# Altium schematic sheet PSU.SchDoc: PDM
size A3; Author: Gustavo Gago; CompanyName: eUSRacing; DrawnBy: Gustavo Gago; SheetNumber: 8; SheetTotal: 8
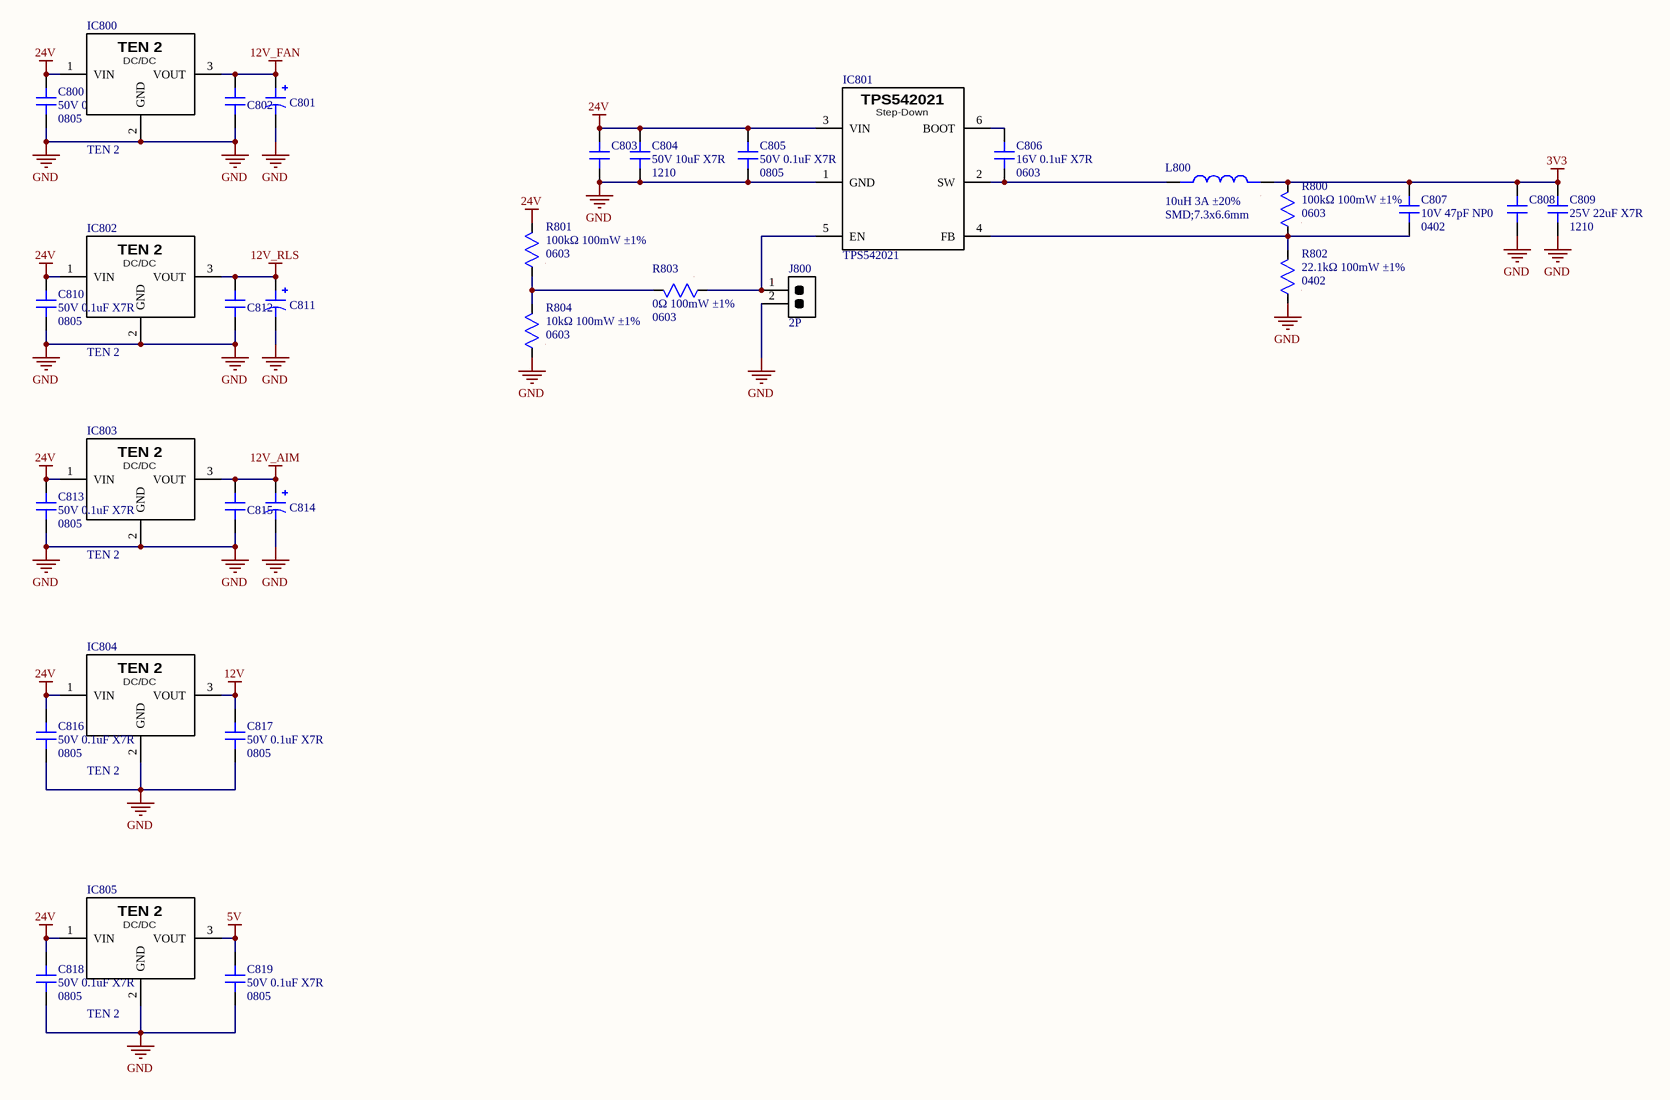
[diagram p0: PSU.SchDoc]

## Parts
C800  value 50V 0.1uF X7R  Package: 0805  [CAP SMD 0805]  (hidden comment: CAP non polarized)
C801  CAP polarized  [CAP_SMD_D6.3xL7.7mm]  (value not drawn)
C802  CAP non polarized  [CAP SMD 0805]  (value not drawn)
C803  CAP non polarized  [CAP SMD 1210]  (value not drawn)
C804  value 50V 10uF X7R  Package: 1210  [CAP SMD 1210]  (hidden comment: CAP non polarized)
C805  value 50V 0.1uF X7R  Package: 0805  [CAP SMD 0805]  (hidden comment: CAP non polarized)
C806  value 16V 0.1uF X7R  Package: 0603  [CAP SMD 0603]  (hidden comment: CAP non polarized)
C807  value 10V 47pF NP0  Package: 0402  [CAP SMD 0402]  (hidden comment: CAP non polarized)
C808  CAP non polarized  [CAP SMD 1210]  (value not drawn)
C809  value 25V 22uF X7R  Package: 1210  [CAP SMD 1210]  (hidden comment: CAP non polarized)
C810  value 50V 0.1uF X7R  Package: 0805  [CAP SMD 0805]  (hidden comment: CAP non polarized)
C811  CAP polarized  [CAP_SMD_D6.3xL7.7mm]  (value not drawn)
C812  CAP non polarized  [CAP SMD 0805]  (value not drawn)
C813  value 50V 0.1uF X7R  Package: 0805  [CAP SMD 0805]  (hidden comment: CAP non polarized)
C814  CAP polarized  [CAP_SMD_D6.3xL7.7mm]  (value not drawn)
C815  CAP non polarized  [CAP SMD 0805]  (value not drawn)
C816  value 50V 0.1uF X7R  Package: 0805  [CAP SMD 0805]  (hidden comment: CAP non polarized)
C817  value 50V 0.1uF X7R  Package: 0805  [CAP SMD 0805]  (hidden comment: CAP non polarized)
C818  value 50V 0.1uF X7R  Package: 0805  [CAP SMD 0805]  (hidden comment: CAP non polarized)
C819  value 50V 0.1uF X7R  Package: 0805  [CAP SMD 0805]  (hidden comment: CAP non polarized)
IC800  TEN 2  [TEN 2]
IC801  TPS542021  [TSOT-23-6]
IC802  TEN 2  [TEN 2]
IC803  TEN 2  [TEN 2]
IC804  TEN 2  [TEN 2]
IC805  TEN 2  [TEN 2]
J800  value 2P  [PIN_HEADER_THT_2P]  (hidden comment: CONN 2P)
L800  value 10uH 3A ±20%  Package: SMD;7.3x6.6mm  [IND SMD 7.3x6.6]  (hidden comment: IND)
R800  value 100kΩ 100mW ±1%  Package: 0603  [RES SMD 0603]  (hidden comment: RES)
R801  value 100kΩ 100mW ±1%  Package: 0603  [RES SMD 0603]  (hidden comment: RES)
R802  value 22.1kΩ 100mW ±1%  Package: 0402  [RES SMD 0402]  (hidden comment: RES)
R803  value 0Ω 100mW ±1%  Package: 0603  [RES SMD 0603]  (hidden comment: RES)
R804  value 10kΩ 100mW ±1%  Package: 0603  [RES SMD 0603]  (hidden comment: RES)

## Nets
3V3: C807.1 C808.1 C809.1 L800.2 R800.2
5V: C819.1 IC805.3(VOUT)
12V: C817.1 IC804.3(VOUT)
12V_AIM: C814.P C815.1 IC803.3(VOUT)
12V_FAN: C801.P C802.1 IC800.3(VOUT)
12V_RLS: C811.P C812.1 IC802.3(VOUT)
24V: C800.1 C803.1 C804.1 C805.1 C810.1 C813.1 C816.1 C818.1 IC800.1(VIN) IC801.3(VIN) IC802.1(VIN) IC803.1(VIN) IC804.1(VIN) IC805.1(VIN) R801.2
GND: C800.2 C801.N C802.2 C803.2 C804.2 C805.2 C808.2 C809.2 C810.2 C811.N C812.2 C813.2 C814.N C815.2 C816.2 C817.2 C818.2 C819.2 IC800.2(GND) IC801.1(GND) IC802.2(GND) IC803.2(GND) IC804.2(GND) IC805.2(GND) J800.2 R802.1 R804.1
NetC806_1: C806.1 IC801.6(BOOT)
NetC806_2: C806.2 IC801.2(SW) L800.1
NetC807_2: C807.2 IC801.4(FB) R800.1 R802.2
NetIC801_5: IC801.5(EN) J800.1 R803.1
NetR801_1: R801.1 R803.2 R804.2

## Notes on the sheet
- Project:
- Subsystem:
- Company:
- Document:
- Author:
- Revision:
- Date:
- Sheet:
- /
- (in symbol 070-0002) DC/DC
- (in symbol 070-0003) DC/DC
- (in symbol 070-0010) Step-Down

## Library data of the parts
C800 C805 C810 C813 C816-C819 = 001-0100: Condensadores de cerámica multicapa (MLCC- SMD/SMT) WCAP-CSGP 0.1uF 0805 10% 50V MLCC; MPN: 885012207098; Manufacturer: Wurth Elektronik; ComponentLink1Description: Datasheet; ComponentLink1URL: https://www.we-online.com/components/products/datasheet/885012207098.pdf; ComponentLink2Description: Distributor Link; ComponentLink2URL: https://www.mouser.es/ProductDetail/Wurth-Elektronik/885012207098?qs=0KOYDY2FL29sZCNyRsrK9g%3D%3D; ID: 001-0100; Distributor PN: 710-885012207098; Distributor: Mouser
C801 C811 C814 = 002-0001: Aluminium Electrolytic Capacitors - SMD WCAP-ASLI 100uF 35V 20% SMD/SMT; MPN: 865080545012; Manufacturer: Wurth Elektonik; ComponentLink1Description: Datasheet; ComponentLink1URL: https://www.we-online.com/components/products/datasheet/865080545012.pdf; ComponentLink2Description: Distributor Link; ComponentLink2URL: https://www.mouser.es/en/ProductDetail/Wurth-Elektronik/865080545012?qs=sGAEpiMZZMvwFf0viD3Y3aZipiehufnXd0sMoxxC1VosESYZCg0Q6Q%3D%3D; Package: SMD;D6.3xL7.7mm; Value: 100uF 35V 20%; ID: 002-0001; Distributor PN: 710-865080545012; Distributor: Mouser
C802 C812 C815 = 001-0100: Condensadores de cerámica multicapa (MLCC- SMD/SMT) WCAP-CSGP 0.1uF 0805 10% 50V MLCC; MPN: 885012207098; Manufacturer: Wurth Elektronik; Value: 50V 0.1uF X7R; ComponentLink1Description: Datasheet; ComponentLink1URL: https://www.we-online.com/components/products/datasheet/885012207098.pdf; ComponentLink2Description: Distributor Link; ComponentLink2URL: https://www.mouser.es/ProductDetail/Wurth-Elektronik/885012207098?qs=0KOYDY2FL29sZCNyRsrK9g%3D%3D; Package: 0805; ID: 001-0100; Distributor PN: 710-885012207098; Distributor: Mouser
C803 = 001-0104: Condensadores de cerámica multicapa (MLCC- SMD/SMT) WCAP-CSGP 10uF 50Vol 0.1; MPN: 885012209073; Manufacturer: Wurth Elektronik; Value: 50V 10uF X7R; ComponentLink1Description: Datasheet; ComponentLink1URL: https://www.we-online.com/components/products/datasheet/885012209073.pdf; ComponentLink2Description: Distributor Link; ComponentLink2URL: https://www.mouser.es/ProductDetail/Wurth-Elektronik/885012209073?qs=sPbYRqrBIVm8PsM2ljQIMg%3D%3D; Package: 1210; ID: 001-0104; Distributor PN: 710-885012209073; Distributor: Mouser
C804 = 001-0104: Condensadores de cerámica multicapa (MLCC- SMD/SMT) WCAP-CSGP 10uF 50Vol 0.1; MPN: 885012209073; Manufacturer: Wurth Elektronik; ComponentLink1Description: Datasheet; ComponentLink1URL: https://www.we-online.com/components/products/datasheet/885012209073.pdf; ComponentLink2Description: Distributor Link; ComponentLink2URL: https://www.mouser.es/ProductDetail/Wurth-Elektronik/885012209073?qs=sPbYRqrBIVm8PsM2ljQIMg%3D%3D; ID: 001-0104; Distributor PN: 710-885012209073; Distributor: Mouser
C806 = 001-0112: Condensadores de cerámica multicapa (MLCC- SMD/SMT) WCAP-CSGP 0.1uF 0603 10% 16V MLCC; MPN: 885012206046; Manufacturer: Wurth Elektronik; ComponentLink1Description: Datasheet; ComponentLink1URL: https://www.we-online.com/components/products/datasheet/885012206046.pdf; ComponentLink2Description: Distributor Link; ComponentLink2URL: https://www.mouser.es/ProductDetail/Wurth-Elektronik/885012206046?qs=0KOYDY2FL2%252B89gr6HvTBXA%3D%3D; ID: 001-0112; Distributor PN: 710-885012206046; Distributor: Mouser
C807 = 001-0129: Condensadores de cerámica multicapa (MLCC- SMD/SMT) WCAP-CSGP 47pF 0402 5% 10V MLCC; MPN: 885012005011; Manufacturer: Wurth Elektronik; ComponentLink1Description: Datasheet; ComponentLink1URL: https://www.we-online.com/components/products/datasheet/885012005011.pdf; ComponentLink2Description: Distributor Link; ComponentLink2URL: https://www.mouser.es/es/ProductDetail/Wurth-Elektronik/885012005011?qs=0KOYDY2FL2%252BhhKjcjk7u3g%3D%3D; ID: 001-0129; Distributor PN: 710-885012005011; Distributor: Mouser
C808 = 001-0130: Condensadores de cerámica multicapa (MLCC- SMD/SMT) WCAP-CSGP 22 uF 10% 25V -55C / +125C 1210; MPN: 885012209074; Manufacturer: Wurth Elektronik; Value: 25V 22uF X7R; ComponentLink1Description: Datasheet; ComponentLink1URL: https://www.we-online.com/components/products/datasheet/885012209074.pdf; ComponentLink2Description: Distributor Link; ComponentLink2URL: https://www.mouser.es/es/ProductDetail/Wurth-Elektronik/885012209074?qs=1Kr7Jg1SGW9K59bdFULB3w%3D%3D; Package: 1210; ID: 001-0130; Distributor PN: 710-885012209074; Distributor: Mouser
C809 = 001-0130: Condensadores de cerámica multicapa (MLCC- SMD/SMT) WCAP-CSGP 22 uF 10% 25V -55C / +125C 1210; MPN: 885012209074; Manufacturer: Wurth Elektronik; ComponentLink1Description: Datasheet; ComponentLink1URL: https://www.we-online.com/components/products/datasheet/885012209074.pdf; ComponentLink2Description: Distributor Link; ComponentLink2URL: https://www.mouser.es/es/ProductDetail/Wurth-Elektronik/885012209074?qs=1Kr7Jg1SGW9K59bdFULB3w%3D%3D; ID: 001-0130; Distributor PN: 710-885012209074; Distributor: Mouser
IC800 IC802-IC804 = 070-0003: Convertidores DC/DC para montaje pasante 15-36Vin 12V 2A SIP switching regulator; MPN: TSR 2-24120; Manufacturer: TRACO Power; Value: 24V-12V; ComponentLink1Description: Datasheet; ComponentLink1URL: https://www.tracopower.com/tsr2-datasheet; ComponentLink2Description: Distributor Link; ComponentLink2URL: https://www.mouser.es/ProductDetail/TRACO-Power/TSR-2-24120?qs=NtE2QagKf6T34HiGRDOLrw%3D%3D; ID: 070-0003; Package: 14.0x7.5x10.1mm; Distributor PN: 495-TSR2-24120; Distributor: Mouser
IC801 = 070-0010: Reguladores de tensión de conmutación 4.5V-to-30V input, 2A 500kHz synchronous buck converter; MPN: TPS542021DDCR; Manufacturer: Texas Instruments; ComponentLink1Description: Datasheet; ComponentLink1URL: https://www.ti.com/lit/ds/symlink/tps542021.pdf?ts=1794189706281&ref_url=https%253A%252F%252Fwww.ti.com%252Fsitesearch%252Fen-us%252Fdocs%252Funiversalsearch.tsp%253FlangPref%253Den-US%2526nr%253D7%2526searchTerm%253DTPS542021DDCR; ComponentLink2Description: Distributor Link; ComponentLink2URL: https://www.mouser.es/es/ProductDetail/Texas-Instruments/TPS542021DDCR?qs=dhCoiiGcT1LnO2fomclYkQ%3D%3D; ID: 070-0010; Value: -; Package: TSOT-23-6; Distributor PN: 595-TPS542021DDCR; Distributor: Mouser
IC805 = 070-0002: Convertidores DC/DC para montaje pasante 6.5-36Vin 5V 2A SIP switching regulator; MPN: TSR 2-2450; Manufacturer: TRACO Power; Value: 24V-5V; ComponentLink1Description: Datasheet; ComponentLink1URL: https://www.tracopower.com/tsr2-datasheet; ComponentLink2Description: Distributor Link; ComponentLink2URL: https://www.mouser.es/ProductDetail/TRACO-Power/TSR-2-2450?qs=NtE2QagKf6RzknAolzm%2FTQ%3D%3D; ID: 070-0002; Package: 14.0x7.5x10.1mm; Distributor PN: 495-TSR2-2450; Distributor: Mouser
J800 = 110-0061: Alojamientos de cables y cabecera 2.54MM HIGH TEMP PCB HDR STRIP; MPN: HTSW-102-07-G-S; Manufacturer: Samtec; ComponentLink1Description: Datasheet; ComponentLink1URL: https://www.mouser.es/datasheet/3/85/1/htsw_th.pdf; ComponentLink2Description: Distributor Link; ComponentLink2URL: https://www.mouser.es/ProductDetail/Samtec/HTSW-102-07-G-S?qs=FESYatJ8odI1BCBanfu%2FIg%3D%3D; ID: 110-0061; Package: THT 2,54mm; Distributor PN: 200-HTSW10207GS; Distributor: Mouser
L800 = 020-0003: Inductores de potencia (SMD) WE-LHMI Powr SMD7030 10uH 3.0A 85mOhm; MPN: 74437346100; Manufacturer: Wurth Elektronik; ComponentLink1Description: Datasheet; ComponentLink1URL: https://www.we-online.com/components/products/datasheet/74437346100.pdf; ComponentLink2Description: Distributor Link; ComponentLink2URL: https://www.mouser.es/ProductDetail/Wurth-Elektronik/74437346100?qs=cFlH0mFHHFqNHncV%252BuVFvQ%3D%3D; ID: 020-0003; Distributor PN: 710-74437346100; Distributor: Mouser
R800 R801 = 010-0190: Thick Film Resistors WRIS-RSKS 100 kOhms 1 % 0.1 W 0603 AEC-Q200; MPN: 560112116004; Manufacturer: Wurth Elektronik; ComponentLink1Description: Datasheet; ComponentLink1URL: https://www.we-online.com/components/products/datasheet/560112116004.pdf; ComponentLink2Description: Distributor Link; ComponentLink2URL: https://www.mouser.es/ProductDetail/Wurth-Elektronik/560112116004?qs=sGAEpiMZZMvdGkrng054txLI%2FDB4oIKDB%252BmfBE1ySSGuQklCN21gzA%3D%3D; ID: 010-0190; Distributor PN: 710-560112116004; Distributor: Mouser
R802 = 010-0157: Resistores de película gruesa - SMD WRIS-RSKS 22.1 kOhms 1 % 0.1 W 0402 AEC-Q200; MPN: 560112110099; Manufacturer: Wurth Elektronik; ComponentLink1Description: Datasheet; ComponentLink1URL: https://www.we-online.com/components/products/datasheet/560112110099.pdf; ComponentLink2Description: Distributor Link; ComponentLink2URL: https://www.mouser.es/ProductDetail/Wurth-Elektronik/560112110099?qs=mELouGlnn3eF8MLEVMJrCw%3D%3D; ID: 010-0157; Distributor PN: 710-560112110099; Distributor: Mouser
R803 = 010-0160: Resistores de película gruesa - SMD WRIS-RSKS <0.05 Ohms 0.1 W Jumper 0603 AEC-Q200; MPN: 560112116001; Manufacturer: Wurth Elektronik; ComponentLink1Description: Datasheet; ComponentLink1URL: https://www.we-online.com/components/products/datasheet/560112116001.pdf; ComponentLink2Description: Distributor Link; ComponentLink2URL: https://www.mouser.es/ProductDetail/Wurth-Elektronik/560112116001?qs=mELouGlnn3dlnHYj7TecuA%3D%3D; ID: 010-0160; Distributor PN: 710-560112116001; Distributor: Mouser
R804 = 010-0145: Resistores de película gruesa - SMD WRIS-RSKS 10 kOhms 1 % 0.1 W 0603 AEC-Q200; MPN: 560112116005; Manufacturer: Wurth Elektronik; ComponentLink1Description: Datasheet; ComponentLink1URL: https://www.we-online.com/components/products/datasheet/560112116005.pdf; ComponentLink2Description: Distributor Link; ComponentLink2URL: https://www.mouser.es/ProductDetail/Wurth-Elektronik/560112116005?qs=mELouGlnn3dMVSPHwBGouA%3D%3D; ID: 010-0145; Distributor PN: 710-560112116005; Distributor: Mouser